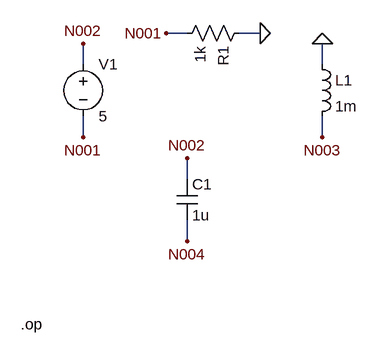
[diagram p0: schematic C10_D2_P1.asc]
C10_D2_P1.asc, the LTspice schematic file:
Version 4
SHEET 1 880 736
WIRE 400 128 432 128
WIRE 528 176 528 144
WIRE 320 128 288 128
WIRE 160 256 160 288
WIRE 160 176 160 144
WIRE 320 352 320 320
WIRE 528 256 528 288
WIRE 320 416 320 448
FLAG 432 128 0
FLAG 528 144 0
FLAG 288 128 N001
FLAG 160 288 N001
FLAG 160 144 N002
FLAG 320 320 N002
FLAG 528 288 N003
FLAG 320 448 N004
SYMBOL res 416 112 R90
SYMATTR InstName R1
SYMATTR Value 1k
SYMBOL voltage 160 160 R0
SYMATTR InstName V1
SYMATTR Value 5
SYMBOL ind 512 160 R0
SYMATTR InstName L1
SYMATTR Value 1m
SYMBOL cap 304 352 R0
SYMATTR InstName C1
SYMATTR Value 1u
TEXT 64 576 Left 2 !.op

The netlist it stands for:
* C10_D2_P1.asc
R1 0 N001 1k
V1 N002 N001 5
L1 0 N003 1m
C1 N002 N004 1u
.op
.backanno
.end